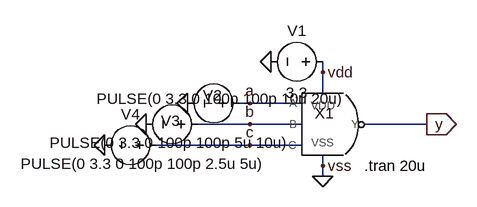
[diagram p0: schematic nand3_tb_tran.asc]
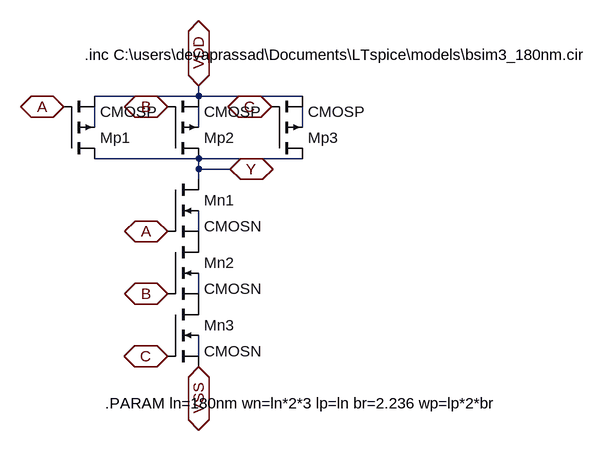
[diagram p1: sub-circuit nand3.asc]
nand3_tb_tran.asc, the LTspice schematic file:
Version 4.1
SHEET 1 880 680
WIRE 176 80 176 64
WIRE 176 112 176 80
WIRE 64 128 48 128
WIRE 144 128 64 128
WIRE 64 160 -16 160
WIRE 144 160 64 160
WIRE 336 160 240 160
WIRE 64 192 -80 192
WIRE 144 192 64 192
WIRE 176 224 176 208
WIRE 176 240 176 224
FLAG 176 240 0
FLAG 96 64 0
FLAG -32 128 0
FLAG -96 160 0
FLAG 336 160 y
IOPIN 336 160 Out
FLAG 64 160 b
FLAG 64 128 a
FLAG 176 224 vss
FLAG 176 80 vdd
FLAG -160 192 0
FLAG 64 192 c
SYMBOL voltage 192 64 R90
WINDOW 0 -32 56 VBottom 2
WINDOW 3 32 56 VTop 2
WINDOW 123 0 0 Left 0
WINDOW 39 0 0 Left 0
SYMATTR InstName V1
SYMATTR Value 3.3
SYMBOL voltage 64 128 R90
WINDOW 0 3 58 VBottom 2
WINDOW 3 -23 44 VTop 2
WINDOW 123 0 0 Left 0
WINDOW 39 0 0 Left 0
SYMATTR InstName V2
SYMATTR Value PULSE(0 3.3 0 100p 100p 10u 20u)
SYMBOL voltage 0 160 R90
WINDOW 0 10 58 VBottom 2
WINDOW 3 13 59 VTop 2
WINDOW 123 0 0 Left 0
WINDOW 39 0 0 Left 0
SYMATTR InstName V3
SYMATTR Value PULSE(0 3.3 0 100p 100p 5u 10u)
SYMBOL nand3 208 192 R0
SYMATTR InstName X1
SYMBOL voltage -64 192 R90
WINDOW 0 -32 56 VBottom 2
WINDOW 3 13 36 VTop 2
WINDOW 123 0 0 Left 0
WINDOW 39 0 0 Left 0
SYMATTR InstName V4
SYMATTR Value PULSE(0 3.3 0 100p 100p 2.5u 5u)
TEXT 240 224 Left 2 !.tran 20u

nand3.asc, the sub-circuit schematic file:
Version 4.1
SHEET 1 880 680
WIRE 208 -64 208 -80
WIRE 208 -64 48 -64
WIRE 368 -64 208 -64
WIRE 48 -16 48 -48
WIRE 208 -16 208 -48
WIRE 368 -16 368 -48
WIRE 208 32 48 32
WIRE 368 32 208 32
WIRE 208 48 208 32
WIRE 256 48 208 48
WIRE 208 64 208 48
WIRE 208 144 208 112
WIRE 208 240 208 208
WIRE 208 336 208 304
FLAG 0 -48 A
IOPIN 0 -48 BiDir
FLAG 160 -48 B
IOPIN 160 -48 BiDir
FLAG 320 -48 C
IOPIN 320 -48 BiDir
FLAG 160 144 A
IOPIN 160 144 BiDir
FLAG 160 240 B
IOPIN 160 240 BiDir
FLAG 160 336 C
IOPIN 160 336 BiDir
FLAG 208 352 VSS
IOPIN 208 352 BiDir
FLAG 208 -80 VDD
IOPIN 208 -80 BiDir
FLAG 256 48 Y
IOPIN 256 48 BiDir
SYMBOL nmos4 160 64 R0
SYMATTR InstName Mn1
SYMATTR Value CMOSN
SYMATTR Value2 l={ln} w={wn} ad={ln*wn} as={ln*wn} pd={2*ln+wn} ps={2*ln+wn}
SYMBOL pmos4 0 32 M180
SYMATTR InstName Mp1
SYMATTR Value CMOSP
SYMATTR Value2 l={lp} w={wp} ad={lp*wp} as={lp*wp} pd={2*lp+wp} ps={2*lp+wp}
SYMBOL nmos4 160 160 R0
SYMATTR InstName Mn2
SYMATTR Value CMOSN
SYMATTR Value2 l={ln} w={wn} ad={ln*wn} as={ln*wn} pd={2*ln+wn} ps={2*ln+wn}
SYMBOL nmos4 160 256 R0
SYMATTR InstName Mn3
SYMATTR Value CMOSN
SYMATTR Value2 l={ln} w={wn} ad={ln*wn} as={ln*wn} pd={2*ln+wn} ps={2*ln+wn}
SYMBOL pmos4 160 32 M180
SYMATTR InstName Mp2
SYMATTR Value CMOSP
SYMATTR Value2 l={lp} w={wp} ad={lp*wp} as={lp*wp} pd={2*lp+wp} ps={2*lp+wp}
SYMBOL pmos4 320 32 M180
SYMATTR InstName Mp3
SYMATTR Value CMOSP
SYMATTR Value2 l={lp} w={wp} ad={lp*wp} as={lp*wp} pd={2*lp+wp} ps={2*lp+wp}
TEXT 32 -128 Left 2 !.inc C:\\users\\devaprassad\\Documents\\LTspice\\models\\bsim3_180nm.cir
TEXT 64 408 Left 2 !.PARAM ln=180nm wn=ln*2*3 lp=ln br=2.236 wp=lp*2*br

The netlist it stands for:
* nand3_tb_tran.asc
V1 vdd 0 3.3
V2 a 0 PULSE(0 3.3 0 100p 100p 10u 20u)
V3 b 0 PULSE(0 3.3 0 100p 100p 5u 10u)
X§X1 a b c vdd 0 y nand3
V4 c 0 PULSE(0 3.3 0 100p 100p 2.5u 5u)

* block symbol definitions
.subckt nand3 A B C VDD VSS Y
Mn1 Y A P001 N004 CMOSN l={ln} w={wn} ad={ln*wn} as={ln*wn} pd={2*ln+wn} ps={2*ln+wn}
Mp1 Y A VDD N001 CMOSP l={lp} w={wp} ad={lp*wp} as={lp*wp} pd={2*lp+wp} ps={2*lp+wp}
Mn2 P001 B P002 N005 CMOSN l={ln} w={wn} ad={ln*wn} as={ln*wn} pd={2*ln+wn} ps={2*ln+wn}
Mn3 P002 C VSS N006 CMOSN l={ln} w={wn} ad={ln*wn} as={ln*wn} pd={2*ln+wn} ps={2*ln+wn}
Mp2 Y B VDD N002 CMOSP l={lp} w={wp} ad={lp*wp} as={lp*wp} pd={2*lp+wp} ps={2*lp+wp}
Mp3 Y C VDD N003 CMOSP l={lp} w={wp} ad={lp*wp} as={lp*wp} pd={2*lp+wp} ps={2*lp+wp}
.inc C:\users\devaprassad\Documents\LTspice\models\bsim3_180nm.cir
.PARAM ln=180nm wn=ln*2*3 lp=ln br=2.236 wp=lp*2*br
.ends nand3

.model NMOS NMOS
.model PMOS PMOS
.lib standard.mos
.tran 20u
.backanno
.end